# Altium schematic sheet MCU.SchDoc: =DT_SCH_Title
size A3; Organization: Droid Technologies; SheetNumber: 3; SheetTotal: 16
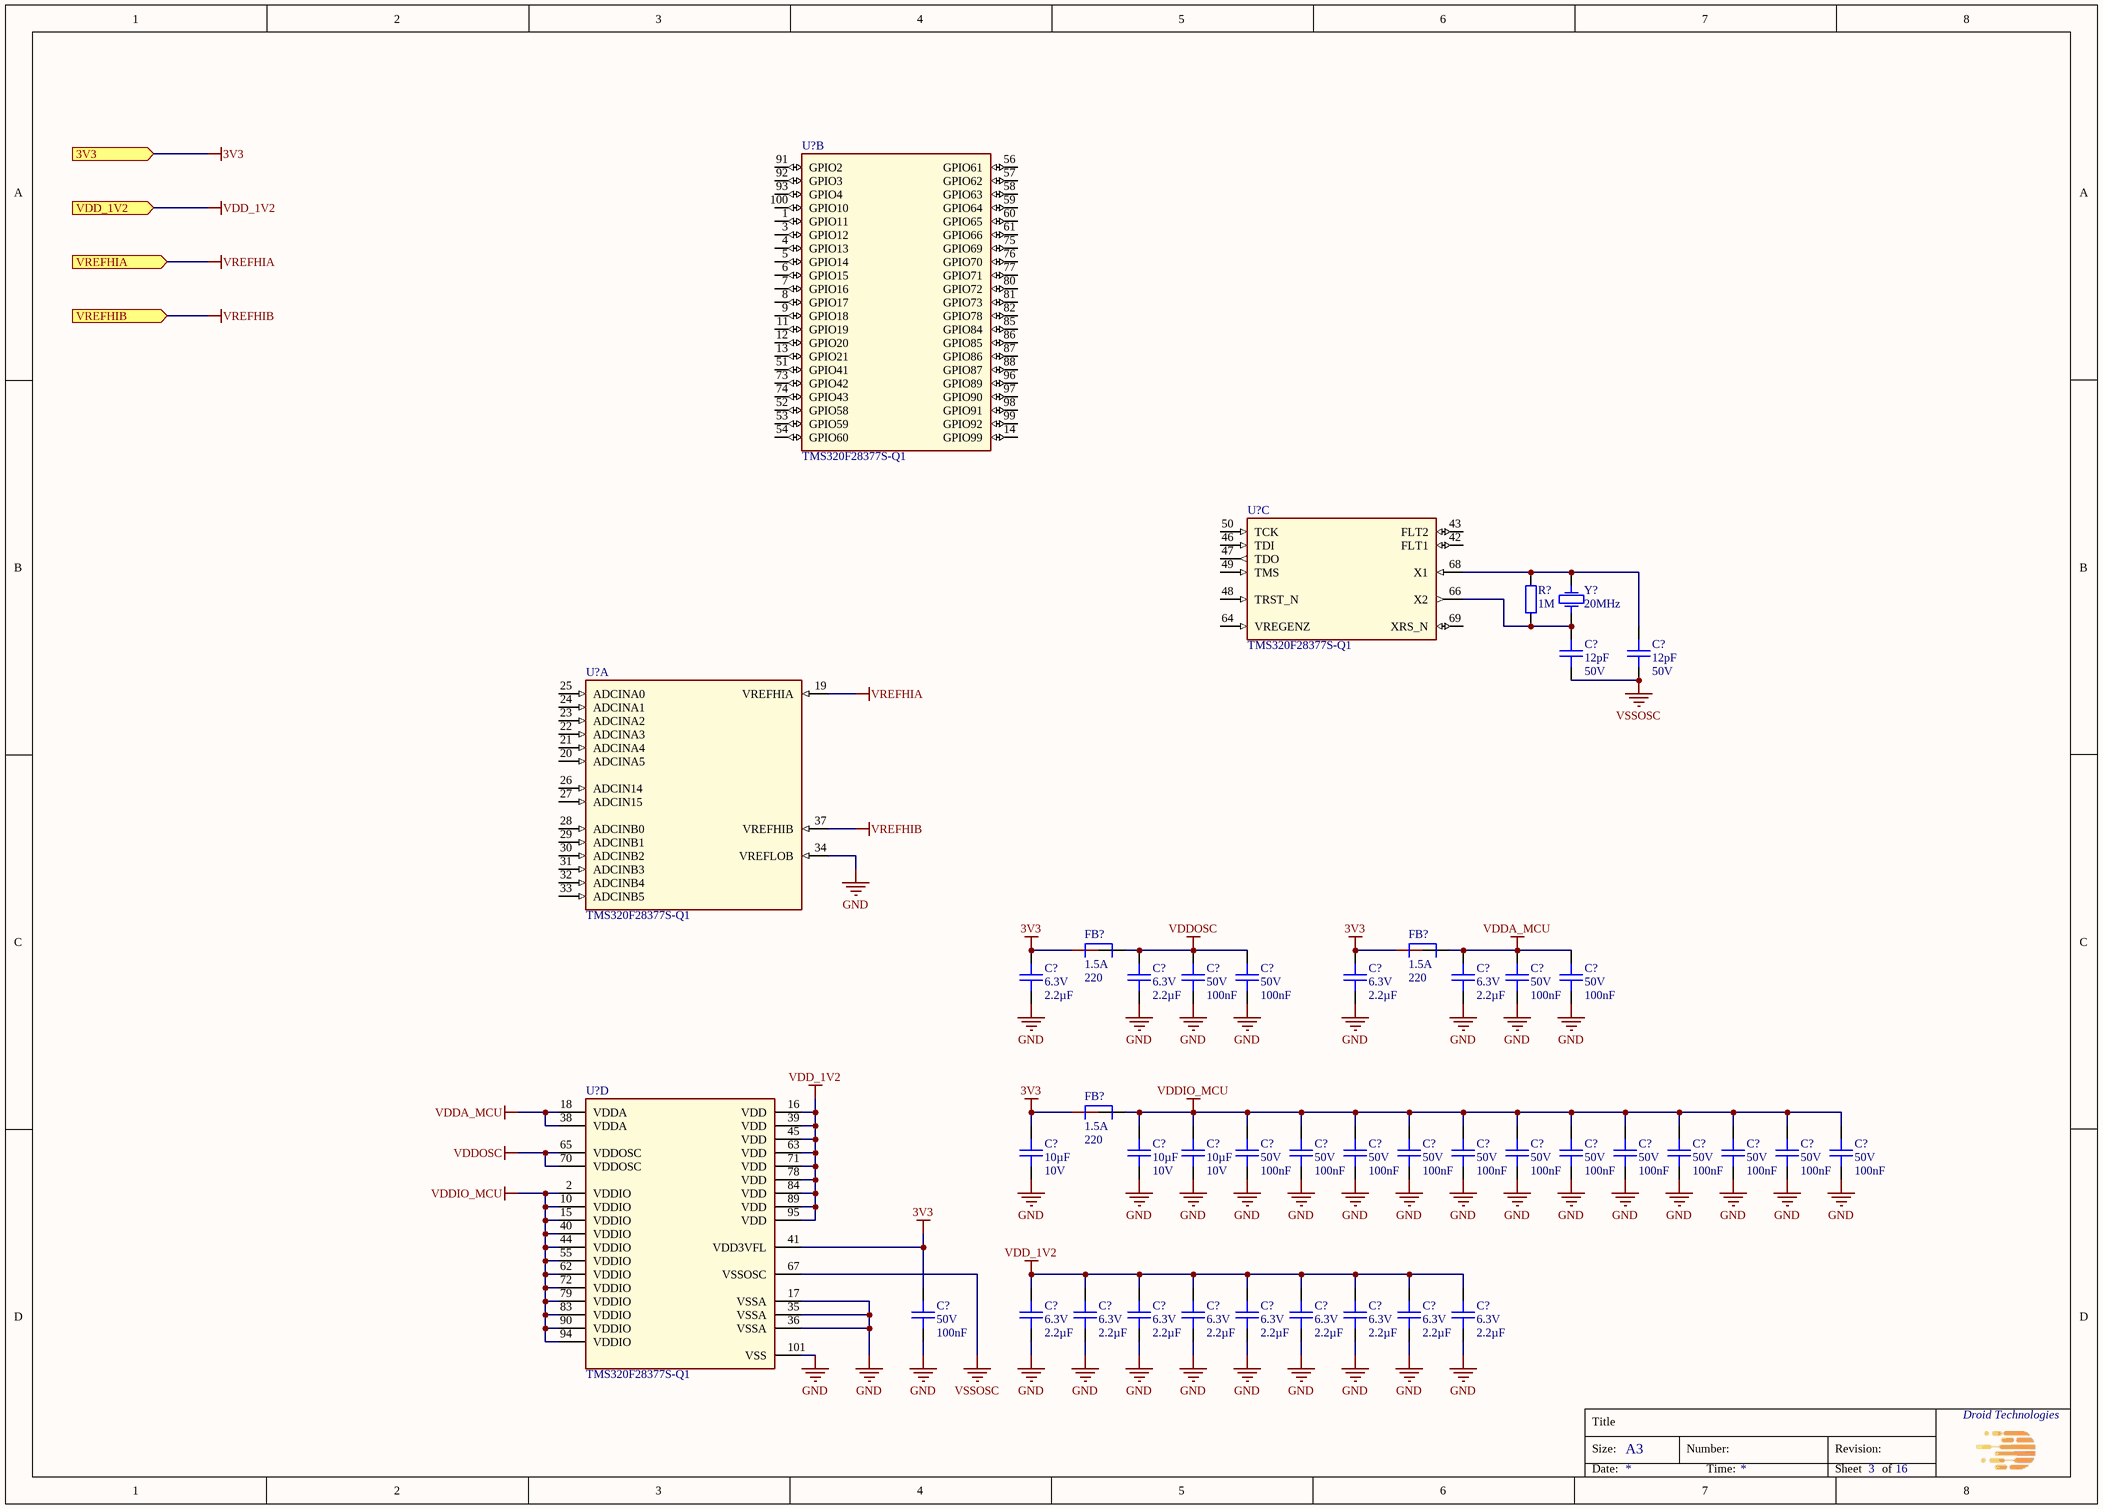
[diagram p0: MCU.SchDoc]

## Parts
(Parts that share a designator on the sheet are numbered #1, #2 ... from top to bottom, then left to right.)
C?#1  Capacitance: 12pF  Voltage Rating: 50V  [CAPC100x50x50L25]  (hidden comment: C0402C120J5HACAUTO)
C?#2  Capacitance: 12pF  Voltage Rating: 50V  [CAPC100x50x50L25]  (hidden comment: C0402C120J5HACAUTO)
C?#3  Voltage Rating: 6.3V  Capacitance: 2.2µF  [CAPC160X80X90L35]  (hidden comment: C1608X8L0J225K080AC)
C?#4  Voltage Rating: 6.3V  Capacitance: 2.2µF  [CAPC160X80X90L35]  (hidden comment: C1608X8L0J225K080AC)
C?#5  Voltage Rating: 50V  Capacitance: 100nF  [CAPC100x50x50L25]  (hidden comment: GCM155L8EH104KE07D)
C?#6  Voltage Rating: 50V  Capacitance: 100nF  [CAPC100x50x50L25]  (hidden comment: GCM155L8EH104KE07D)
C?#7  Voltage Rating: 6.3V  Capacitance: 2.2µF  [CAPC160X80X90L35]  (hidden comment: C1608X8L0J225K080AC)
C?#8  Voltage Rating: 6.3V  Capacitance: 2.2µF  [CAPC160X80X90L35]  (hidden comment: C1608X8L0J225K080AC)
C?#9  Voltage Rating: 50V  Capacitance: 100nF  [CAPC100x50x50L25]  (hidden comment: GCM155L8EH104KE07D)
C?#10  Voltage Rating: 50V  Capacitance: 100nF  [CAPC100x50x50L25]  (hidden comment: GCM155L8EH104KE07D)
C?#11  Capacitance: 10µF  Voltage Rating: 10V  [CAPC200X125X145L50]  (hidden comment: CGA4J1X8L1A106K125AC)
C?#12  Capacitance: 10µF  Voltage Rating: 10V  [CAPC200X125X145L50]  (hidden comment: CGA4J1X8L1A106K125AC)
C?#13  Capacitance: 10µF  Voltage Rating: 10V  [CAPC200X125X145L50]  (hidden comment: CGA4J1X8L1A106K125AC)
C?#14  Voltage Rating: 50V  Capacitance: 100nF  [CAPC100x50x50L25]  (hidden comment: GCM155L8EH104KE07D)
C?#15  Voltage Rating: 50V  Capacitance: 100nF  [CAPC100x50x50L25]  (hidden comment: GCM155L8EH104KE07D)
C?#16  Voltage Rating: 50V  Capacitance: 100nF  [CAPC100x50x50L25]  (hidden comment: GCM155L8EH104KE07D)
C?#17  Voltage Rating: 50V  Capacitance: 100nF  [CAPC100x50x50L25]  (hidden comment: GCM155L8EH104KE07D)
C?#18  Voltage Rating: 50V  Capacitance: 100nF  [CAPC100x50x50L25]  (hidden comment: GCM155L8EH104KE07D)
C?#19  Voltage Rating: 50V  Capacitance: 100nF  [CAPC100x50x50L25]  (hidden comment: GCM155L8EH104KE07D)
C?#20  Voltage Rating: 50V  Capacitance: 100nF  [CAPC100x50x50L25]  (hidden comment: GCM155L8EH104KE07D)
C?#21  Voltage Rating: 50V  Capacitance: 100nF  [CAPC100x50x50L25]  (hidden comment: GCM155L8EH104KE07D)
C?#22  Voltage Rating: 50V  Capacitance: 100nF  [CAPC100x50x50L25]  (hidden comment: GCM155L8EH104KE07D)
C?#23  Voltage Rating: 50V  Capacitance: 100nF  [CAPC100x50x50L25]  (hidden comment: GCM155L8EH104KE07D)
C?#24  Voltage Rating: 50V  Capacitance: 100nF  [CAPC100x50x50L25]  (hidden comment: GCM155L8EH104KE07D)
C?#25  Voltage Rating: 50V  Capacitance: 100nF  [CAPC100x50x50L25]  (hidden comment: GCM155L8EH104KE07D)
C?#26  Voltage Rating: 50V  Capacitance: 100nF  [CAPC100x50x50L25]  (hidden comment: GCM155L8EH104KE07D)
C?#27  Voltage Rating: 6.3V  Capacitance: 2.2µF  [CAPC160X80X90L35]  (hidden comment: C1608X8L0J225K080AC)
C?#28  Voltage Rating: 6.3V  Capacitance: 2.2µF  [CAPC160X80X90L35]  (hidden comment: C1608X8L0J225K080AC)
C?#29  Voltage Rating: 6.3V  Capacitance: 2.2µF  [CAPC160X80X90L35]  (hidden comment: C1608X8L0J225K080AC)
C?#30  Voltage Rating: 6.3V  Capacitance: 2.2µF  [CAPC160X80X90L35]  (hidden comment: C1608X8L0J225K080AC)
C?#31  Voltage Rating: 6.3V  Capacitance: 2.2µF  [CAPC160X80X90L35]  (hidden comment: C1608X8L0J225K080AC)
C?#32  Voltage Rating: 6.3V  Capacitance: 2.2µF  [CAPC160X80X90L35]  (hidden comment: C1608X8L0J225K080AC)
C?#33  Voltage Rating: 6.3V  Capacitance: 2.2µF  [CAPC160X80X90L35]  (hidden comment: C1608X8L0J225K080AC)
C?#34  Voltage Rating: 6.3V  Capacitance: 2.2µF  [CAPC160X80X90L35]  (hidden comment: C1608X8L0J225K080AC)
C?#35  Voltage Rating: 6.3V  Capacitance: 2.2µF  [CAPC160X80X90L35]  (hidden comment: C1608X8L0J225K080AC)
FB?#1  Imax: 1.5A  Impedance: 220  [BEADC160X80X95L40]  (hidden comment: BLM18KG221BH1D)
FB?#2  Imax: 1.5A  Impedance: 220  [BEADC160X80X95L40]  (hidden comment: BLM18KG221BH1D)
FB?#3  Imax: 1.5A  Impedance: 220  [BEADC160X80X95L40]  (hidden comment: BLM18KG221BH1D)
R?  Resistance: 1M  [RESC100X50X40L25]  (hidden comment: RC0402FR-071ML)
U?#1  TMS320F28377S-Q1  [100-HTQFP (14x14)]  (part B of 4)
U?#2  TMS320F28377S-Q1  [100-HTQFP (14x14)]  (part C of 4)
U?#3  TMS320F28377S-Q1  [100-HTQFP (14x14)]  (part A of 4)
U?#4  TMS320F28377S-Q1  [100-HTQFP (14x14)]  (part D of 4)
Y?  20MHz  [NX5032GA]

## Ports
3V3 (in), VDD_1V2 (in), VREFHIA (in), VREFHIB (in)

## Nets
3V3: C?#3.2 C?#7.2 C?#11.2 C?#26.2 FB?#1.1 FB?#2.1 FB?#3.1 U?#4.41(VDD3VFL) ; port 3V3
GND: C?#3.1 C?#4.1 C?#5.1 C?#6.1 C?#7.1 C?#8.1 C?#9.1 C?#10.1 C?#11.1 C?#12.1 C?#13.1 C?#14.1 C?#15.1 C?#16.1 C?#17.1 C?#18.1 C?#19.1 C?#20.1 C?#21.1 C?#22.1 C?#23.1 C?#24.1 C?#25.1 C?#26.1 C?#27.1 C?#28.1 C?#29.1 C?#30.1 C?#31.1 C?#32.1 C?#33.1 C?#34.1 C?#35.1 U?#3.34(VREFLOB) U?#4.17(VSSA) U?#4.35(VSSA) U?#4.36(VSSA) U?#4.101(VSS)
VDD_1V2: C?#27.2 C?#28.2 C?#29.2 C?#30.2 C?#31.2 C?#32.2 C?#33.2 C?#34.2 C?#35.2 U?#4.16(VDD) U?#4.39(VDD) U?#4.45(VDD) U?#4.63(VDD) U?#4.71(VDD) U?#4.78(VDD) U?#4.84(VDD) U?#4.89(VDD) U?#4.95(VDD) ; port VDD_1V2
VDDA_MCU: C?#8.2 C?#9.2 C?#10.2 FB?#2.2 U?#4.18(VDDA) U?#4.38(VDDA)
VDDIO_MCU: C?#12.2 C?#13.2 C?#14.2 C?#15.2 C?#16.2 C?#17.2 C?#18.2 C?#19.2 C?#20.2 C?#21.2 C?#22.2 C?#23.2 C?#24.2 C?#25.2 FB?#3.2 U?#4.2(VDDIO) U?#4.10(VDDIO) U?#4.15(VDDIO) U?#4.40(VDDIO) U?#4.44(VDDIO) U?#4.55(VDDIO) U?#4.62(VDDIO) U?#4.72(VDDIO) U?#4.79(VDDIO) U?#4.83(VDDIO) U?#4.90(VDDIO) U?#4.94(VDDIO)
VDDOSC: C?#4.2 C?#5.2 C?#6.2 FB?#1.2 U?#4.65(VDDOSC) U?#4.70(VDDOSC)
VREFHIA: U?#3.19(VREFHIA) ; port VREFHIA
VREFHIB: U?#3.37(VREFHIB) ; port VREFHIB
VSSOSC: C?#1.2 C?#2.2 U?#4.67(VSSOSC)
NetC?#1_1: C?#1.1 R?.1 U?#2.66(X2) Y?.1
NetC?#2_1: C?#2.1 R?.2 U?#2.68(X1) Y?.2

Not connected (* = marked no-connect by the designer): U?#1 1(GPIO11) 3(GPIO12) 4(GPIO13) 5(GPIO14) 6(GPIO15) 7(GPIO16) 8(GPIO17) 9(GPIO18) 11(GPIO19) 12(GPIO20) 13(GPIO21) 14(GPIO99) 51(GPIO41) 52(GPIO58) 53(GPIO59) 54(GPIO60) 56(GPIO61) 57(GPIO62) 58(GPIO63) 59(GPIO64) 60(GPIO65) 61(GPIO66) 73(GPIO42) 74(GPIO43) 75(GPIO69) 76(GPIO70) 77(GPIO71) 80(GPIO72) 81(GPIO73) 82(GPIO78) 85(GPIO84) 86(GPIO85) 87(GPIO86) 88(GPIO87) 91(GPIO2) 92(GPIO3) 93(GPIO4) 96(GPIO89) 97(GPIO90) 98(GPIO91) 99(GPIO92) 100(GPIO10); U?#2 42(FLT1) 43(FLT2) 46(TDI) 47(TDO) 48(TRST_N) 49(TMS) 50(TCK) 64(VREGENZ) 69(XRS_N); U?#3 20(ADCINA5) 21(ADCINA4) 22(ADCINA3) 23(ADCINA2) 24(ADCINA1) 25(ADCINA0) 26(ADCIN14) 27(ADCIN15) 28(ADCINB0) 29(ADCINB1) 30(ADCINB2) 31(ADCINB3) 32(ADCINB4) 33(ADCINB5)

## Notes on the sheet
- Title
- Size:
- A3
- Number:
- Revision:
- Date:
- Time:
- Sheet
- of

## Library data of the parts
C?#1 C?#2 = CMP-001-2042-1: CAP CER 0402 12PF 50V ULTRA STAB; Manufacturer: KEMET; Tolerance: 5%; Op Temp min: -55°C; Dielectric: X8R; Op Temp max: 155°C; ComponentLink3URL: https://www.digikey.com/en/products/detail/kemet/C0402C120J5HACAUTO/7955501; ComponentLink1Description: Datasheet; ComponentLink2URL: https://eu.mouser.com/ProductDetail/KEMET/C0402C120J5HACAUTO?qs=j%252B1pi9TdxUZTSOjjZ2f5wA%3D%3D; Size: 1.00mm x 0.50mm; ComponentLink2Description: Mouser; Ratings: AEC-Q200; ComponentLink3Description: Digikey; Mounting Type: SM; Lead Spacing: 0mm; MPN: C0402C120J5HACAUTO; ComponentLink1URL: https://content.kemet.com/datasheets/KEM_C1007_X8R_ULTRA_150C_SMD.pdf; Height max: 500µm; Package: 0402 (1005 Metric)
C?#3 C?#4 C?#7 C?#8 C?#27-C?#35 = CMP-001-2044-1: CAP CER 2.2UF 6.3V X8L 0603; Manufacturer: TDK Corporation; Op Temp min: -55°C; Tolerance: 10%; Op Temp max: 150°C; ComponentLink1URL: https://product.tdk.com/en/search/capacitor/ceramic/mlcc/info?part_no=C1608X8L0J225K080AC; MPN: C1608X8L0J225K080AC; ComponentLink3URL: https://www.digikey.com/en/products/detail/tdk-corporation/C1608X8L0J225K080AC/8343784; ComponentLink1Description: Datasheet; Lead Spacing: 0mm; ComponentLink3Description: Digikey; Package: 0603 (1608 Metric); Height max: 900µm; Size: 1.60mm x 0.80mm; Dielectric: X8L; Ratings: -; Mounting Type: SM; ComponentLink2URL: https://eu.mouser.com/ProductDetail/TDK/C1608X8L0J225K080AC?qs=rrS6PyfT74dgREMaiAoT3Q%3D%3D; ComponentLink2Description: Mouser
C?#5 C?#6 C?#9 C?#10 C?#14-C?#26 = CMP-001-1980-1: CAP CER 0.1UF 50V X8L 0402; Manufacturer: Murata Electronics; Op Temp max: 150°C; Op Temp min: -55°C; Tolerance: 10%; Height max: 550µm; ComponentLink3Description: Digikey; Mounting Type: SM; ComponentLink3URL: https://www.digikey.com/en/products/detail/murata-electronics/GCM155L8EH104KE07D/11618823; Package: 0402 (1005 Metric); Lead Spacing: 0mm; MPN: GCM155L8EH104KE07D; Size: 1.00mm x 0.50mm; Ratings: AEC-Q200; ComponentLink1URL: https://search.murata.co.jp/Ceramy/image/img/A01X/G101/ENG/GCM155L8EH104KE07-01.pdf; ComponentLink1Description: Datasheet; Dielectric: X8L; ComponentLink2Description: Mouser; ComponentLink2URL: https://eu.mouser.com/ProductDetail/Murata-Electronics/GCM155L8EH104KE07D?qs=1mbolxNpo8fQSHf0HYnZWw%3D%3D
C?#11-C?#13 = CMP-001-1984-1: CAP CER 10UF 10V X8L 0805; Manufacturer: TDK Corporation; Tolerance: 10%; Op Temp min: -55°C; Op Temp max: 150°C; ComponentLink3Description: Digikey; Mounting Type: SM; Ratings: AEC-Q200; ComponentLink1Description: Datasheet; ComponentLink3URL: https://www.digikey.com/en/products/detail/tdk-corporation/CGA4J1X8L1A106K125AC/9991388; Lead Spacing: 0mm; MPN: CGA4J1X8L1A106K125AC; Size: 2.00mm x 1.25mm; Height max: 1.5mm; ComponentLink2URL: https://eu.mouser.com/ProductDetail/TDK/CGA4J1X8L1A106K125AC?qs=gZXFycFWdANzH%252B2UvJJjtQ%3D%3D; Package: 0805 (2012 Metric); ComponentLink2Description: Mouser; Dielectric: X8L; ComponentLink1URL: https://product.tdk.com/system/files/dam/doc/product/capacitor/ceramic/mlcc/catalog/mlcc_automotive_hightemp_en.pdf
FB?#1-FB?#3 = CMP-001-1981-1: FERRITE BEAD 220 OHM 0603 1LN; Manufacturer: Murata Electronics; DCR: 50m; Op Temp min: -55°C; Frequency: 100MHz; Op Temp max: 150°C; Number of Lines: 1; Mounting Type: SM; Size: 1.60mm x 0.80mm; ComponentLink2URL: https://eu.mouser.com/ProductDetail/Murata-Electronics/BLM18KG221BH1D?qs=sJ5gq5MLFXpgEHYBdWUtkQ%3D%3D; ComponentLink1Description: Datasheet; ComponentLink1URL: https://www.murata.com/en-us/products/productdata/8798137286686/QNFA9129.pdf; Lead Spacing: 0mm; Ratings: AEC-Q200; ComponentLink3Description: Digikey; ComponentLink3URL: https://www.digikey.com/en/products/detail/murata-electronics/BLM18KG221BH1D/6156000; Height max: 950µm; Package: 0603 (1608 Metric); ComponentLink2Description: Mouser; MPN: BLM18KG221BH1D
R? = CMP-00539-4: RES 1M OHM 1% 1/16W 0402; Manufacturer: YAGEO; Op Temp max: 155°C; Op Temp min: -55°C; Temperature Coefficient: ±100ppm; Power: 63mW; Ratings: -; ComponentLink2URL: https://eu.mouser.com/ProductDetail/YAGEO/RC0402FR-071ML?qs=V1yeUXFNrknfoI4987wfBQ%3D%3D; Height max: 400µm; ComponentLink1Description: Datasheet; Mounting Type: SM; ComponentLink2Description: Mouser; Package: 0402 (1005 Metric); ComponentLink3URL: https://www.digikey.com/en/products/detail/yageo/RC0402FR-071ML/726515; MPN: RC0402FR-071ML; Tolerance: 1%; ComponentLink1URL: https://www.yageo.com/upload/media/product/productsearch/datasheet/rchip/PYu-RC_Group_51_RoHS_L_12.pdf; Composition: Thick Film; Size: 1.00mm x 0.50mm; ComponentLink3Description: Digikey
U?#1-U?#4 = TMS320F28377SPZPQ: IC MCU 32BIT 1MB FLASH 100HTQFP; Manufacturer: Texas Instruments; MPN: TMS320F28377SPZPQ
Y? = STDCSU2-20M: CRYSTAL 20.0000MHZ 8PF SMD; Manufacturer: NDK (NIHON DEMPA KOGYO CO., LTD); MPN: STDCSU2-20M